# EasyEDA Pro project jackt-tong-yong-xiao-che-kong-zhi-qi-zhuan-li-948f377a.epro, board IMU
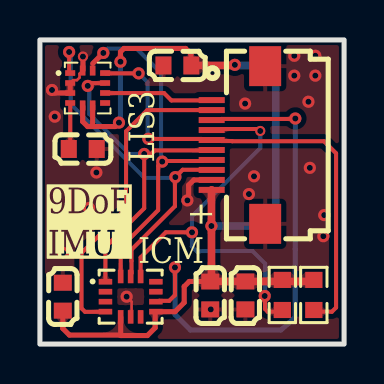
[diagram p8: board, top side]
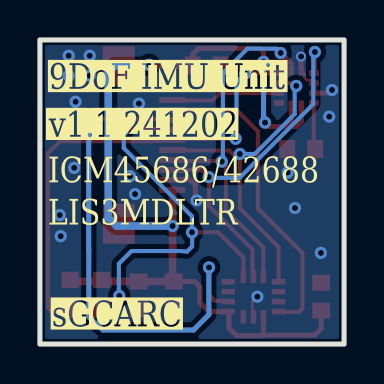
[diagram p9: board, bottom side, seen from below]

Outline 15.24 x 15.24 mm; copper layers: Top Layer, Bottom Layer. Coordinates in mm from the lower left corner of the outline.
Outline path: rectangle 0,15.24 15.24,0
Stack: Top Layer 0.035mm / Dielectric1 1.51mm FR4 er 4.5 / Bottom Layer 0.035mm

## Design rules (mm)
spacing copperThickness1oz (default): track to track 0.102, other pairs 0.152 to 0.3
spacing copperThickness2oz: track to track 0.203, other pairs 0.152 to 0.3
spacing Plane_innerPlane: track to track 0.102, other pairs 0.152 to 0.3
spacing Copper_copperRegion: track to track 0.102, other pairs 0.152 to 0.3
track width copperThickness1oz (default): min 0.127, default 0.254, max 2.54
track width copperThickness2oz: min 0.203, default 0.254, max 2.54
differential pair differentialPair (default): width min 0.127, default 0.254, max 2.54; gap min 0.152, default 0.152
pour e221 uses Copper_copperRegion
pour e244 uses Copper_copperRegion

## Placement (name value [footprint] x y rotation side)
C1  0.1uF  [C0603]  1.15 2.38 270 top
C2  0.1uF  [C0603]  10.3 2.44 90 top
C3  0.1uF  [C0603]  6.89 13.96 0 top
C4  0.1uF  [C0603]  2.15 9.77 180 top
C5  2.2uF  [C0603]  8.53 2.44 90 top
FPC1  AFC01-S10FCA-00  [FPC-SMD_P0.5-10P_FGS-XJ-H2.0]  9.95 9.97 270 top
R1  10K  [R0603]  12.15 2.46 90 top
R2  10K  [R0603]  13.72 2.46 90 top
U1  ICM-45686  [LGA-14_L3.0-W2.5-P0.50-TL]  4.55 2.38 0 top
U2  LIS3MDLTR  [LGA-12_L2.0-W2.0-P0.50-BL]  2.39 12.83 270 top

## Footprints (pads in the part's own frame, mm; a bottom-side part is the same pattern mirrored in y, then rotated)
C0603
  rect 0.8x0.9 smd: 1(-0.7,0) 2(0.7,0)
FPC-SMD_P0.5-10P_FGS-XJ-H2.0
  rect 0.3x1.3 smd: 1(-2.25,-1.339) 2(-1.75,-1.339) 3(-1.25,-1.34) 4(-0.75,-1.339) 5(-0.25,-1.34) 6(0.25,-1.339) 7(0.75,-1.339) 8(1.25,-1.339) 9(1.75,-1.339) 10(2.25,-1.34)
  rect 2x1.6 smd: 11(3.95,1.34) 12(-3.95,1.34)
LGA-12_L2.0-W2.0-P0.50-BL
  rect 0.28x0.5 smd: 1(-0.75,-0.875) 2(-0.25,-0.875) 3(0.25,-0.875) 4(0.75,-0.875) 7(0.75,0.875) 8(0.25,0.875) 9(-0.25,0.875) 10(-0.75,0.875)
  rect 0.5x0.28 smd: 5(0.875,-0.25) 6(0.875,0.25) 11(-0.875,0.25) 12(-0.875,-0.25)
LGA-14_L3.0-W2.5-P0.50-TL
  rect 0.675x0.28 smd: 1(-1.262,0.75) 2(-1.262,0.25) 3(-1.262,-0.25) 4(-1.262,-0.75) 8(1.262,-0.75) 9(1.262,-0.25) 10(1.262,0.25) 11(1.262,0.75)
  rect 0.28x0.675 smd: 5(-0.5,-1.012) 6(0,-1.012) 7(0.5,-1.012) 12(0.5,1.012) 13(0,1.012) 14(-0.5,1.012)
R0603
  rect 0.806x0.864 smd: 1(-0.753,0) 2(0.753,0)

## Nets
As in the schematic.

Pads without a net: U1 2 3 7 10 11; U2 7

## Via types
v1: diameter 0.61, hole 0.305, Top Layer to Bottom Layer, 35 vias
v2: diameter 0.508, hole 0.305, Top Layer to Bottom Layer, 2 vias

## Routing (per net, layer and track width the routed paths; a pad name or vN(x,y) marks a point on that pad's centre or on a via; arc(x,y) is an arc through that point)
3V3: length 47.9
  Top Layer w0.254: C3.2 7.57,13.98 7.57,14.54 7.3,14.81 4.21,14.81 4.04,14.64 v1(4.04,14.15) ; 4.04,0.45 1.48,0.45 1.15,0.78 C1.2 ; 4.04,0.45 4.05,0.46 U1.5 ; 4.04,0.45 4.06,0.43 5.38,0.43 5.77,0.82 5.77,1.59 U1.8 6.77,1.62 7.23,2.08 7.23,2.88 7.48,3.14 C5.2 ; U2.5 2.14,11.15 2.39,10.9 3.76,10.9 v1(3.96,11.1) ; U2.6 2.64,10.9
  Top Layer w0.381: FPC1.10 8.59,7.71 v1(8.59,5.92) 8.59,3.31 8.61,3.3 ; C5.2 C2.2 13.65,3.14 R2.2 ; v1(9.77,13.99) 9.74,13.96 C3.2
  Bottom Layer w0.254: v1(3.96,11.1) 4.04,11.17 v1(4.04,14.15)
  Bottom Layer w0.381: v1(9.77,13.99) 9.8,13.96 11.46,13.96 11.82,13.6 11.82,6.33 11.4,5.92 v1(8.59,5.92)
GND: length 6.3
  Top Layer w0.127: U2.2 1.66,13.22 1.86,13.22 1.98,13.35 1.98,13.54 U2.12 ; 4.59,1.41 4.59,2.13 v1(4.34,2.38)
  Top Layer w0.203: 2.16,13.72 U2.12
  Top Layer w0.254: v1(7.39,7.2) 7.45,7.26 7.45,7.97 7.71,8.22 FPC1.9 ; U2.2 U2.3 0.76,12.58 v1(0.6,12.73) ; v2(2.16,14.41) 2.16,13.72
  vias: v1(0.75,11.39) v1(1.16,4.57) v1(2.46,6.82) v1(2.83,8.6) v1(8.56,1.74) v1(10.28,12.05) v1(10.47,7.52) v1(10.73,8.41) v1(12.74,14.45) v1(12.74,13.45) v1(13.45,12.14) v1(13.52,8.83) v1(13.8,14.45) v1(13.8,13.45) v1(14.25,6.46) v1(14.2,5.41)
ICM_CS: length 21
  Top Layer w0.203: 12.15,1.62 11.41,1.62 11.28,1.76 11.28,2.4 v1(11.26,2.41) ; v2(11.04,10.68) 10.94,10.78 9.09,10.78 9.04,10.72 FPC1.4 ; U1.12 5.05,4.34 6.31,5.6 v1(7.62,5.6)
  Bottom Layer w0.203: v1(11.26,2.41) 11.28,2.43 11.28,4.03 10.65,4.66 8.2,4.66 7.87,4.63 7.61,4.89 7.61,5.59 v1(7.62,5.6) 7.62,6.4 11.04,9.82 v2(11.04,10.68)
ICM_INT: length 15.8
  Top Layer w0.203: U1.4 3.27,1.61 2.26,1.61 2.09,1.79 2.09,4.56 4.32,6.79 4.32,10.66 5.38,11.72 8.61,11.72
IMU_MISO: length 16.7
  Top Layer w0.203: v1(2.4,12.94) 2.54,13.07 3.27,13.07 ; FPC1.6 8.58,9.7 5.75,9.7 5.48,9.43 5.32,9.43 v1(5.22,9.52) 5.22,6.8 3.28,4.86 3.28,3.13 U1.1
  Bottom Layer w0.203: v1(2.4,12.94) 2.47,12.86 2.47,11.53 4.47,9.52 v1(5.22,9.52)
IMU_MOSI: length 17.8
  Top Layer w0.203: U1.14 4.05,4.83 5.92,6.71 5.92,8.94 v1(6.13,9.14) 6.16,9.17 8.12,9.17 8.18,9.22 FPC1.7
  Top Layer w0.254: 2.65,14.06 v1(3.18,14.59)
  Bottom Layer w0.203: v1(3.18,14.59) 3.39,14.8 4.84,14.8 6.07,13.57 6.07,9.2 v1(6.13,9.14)
IMU_SCK: length 18.4
  Top Layer w0.203: U1.13 4.53,3.41 4.53,3.5 4.59,3.56 4.59,4.16 ; 1.52,13.57 1.46,13.63 v1(1.46,14.63) ; 4.59,4.16 4.59,4.73 6.76,6.91 6.76,8.35 v1(6.78,8.37) 7.15,8.73 8.6,8.73 FPC1.8
  Bottom Layer w0.203: v1(6.78,8.37) 6.61,8.37 6.57,8.33 5.24,8.33 1.54,12.02 1.54,14.55 v1(1.46,14.63)
LIS3_CS: length 23.7
  Top Layer w0.203: v1(5.43,10.29) 5.44,10.28 5.73,10.28 5.73,10.28 8.12,10.28 8.18,10.22 FPC1.5 9.04,10.22 9.09,10.17 9.62,10.17 9.63,10.16 14.23,10.16 14.84,9.56 14.84,1.83 14.63,1.62 13.8,1.62 ; v1(4.95,13.56) 3.28,13.56 3.27,13.57
  Bottom Layer w0.203: v1(5.43,10.29) 5.39,10.33 5.39,13.12 v1(4.95,13.56)
LIS3_DRDY: length 5.5
  Top Layer w0.203: 3.27,12.57 6.22,12.57 6.59,12.21 8.59,12.21 FPC1.1
MCO_32K: length 25.6
  Top Layer w0.203: v1(6.77,3.84) 6.77,2.45 6.48,2.17 5.98,2.17 5.94,2.12 U1.9 ; FPC1.3 9.04,11.22 9.09,11.28 12.78,11.28 v1(12.8,11.3)
  Bottom Layer w0.254: 12.5,1.07 12.79,1.37 12.79,4.75 12.8,4.75 v1(12.8,11.3) ; 12.5,1.07 12.48,1.05 ; 12.5,1.07 12.07,0.71 7.54,0.71 6.77,1.47 6.77,3.83 v1(6.77,3.84)
$1N533: length 2.3
  Top Layer w0.203: 1.52,12.07 1.52,9.85 C4.2

## Copper pours and planes (outline as drawn; the poured copper is in the pictures)
GND on Top Layer: -3.52,17.56 17.93,17.56 17.93,-2.72 -3.52,-2.72
GND on Bottom Layer: -9.94,29.94 34.15,29.94 34.15,-21.17 -9.94,-21.17

Small or netless copper shapes (teardrops, artwork), in the pictures only: 54 on Top Layer, 18 on Bottom Layer

## Text on the board
Bottom Silkscreen Layer: sGCARC | 9DoF IMU Unit | v1.1 241202 | ICM45686/42688 / LIS3MDLTR
Top Silkscreen Layer: 9DoF / IMU | ICM | LIS3 | +
